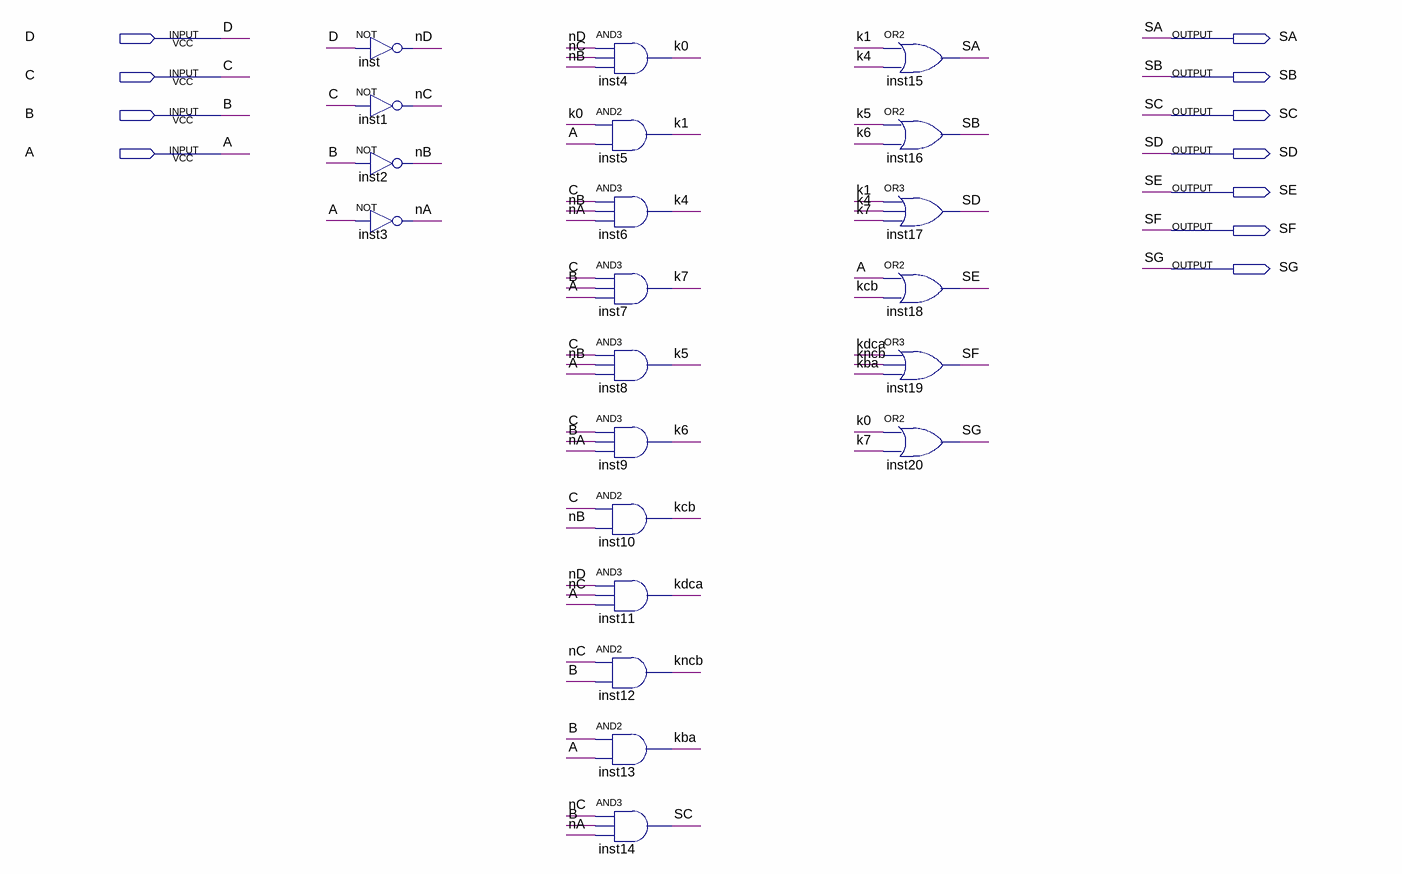
[diagram p0: schematic sheet]
// Quartus schematic seg7.bdf as structural Verilog: 21 symbols, 11 pins
module seg7 (
  input  D,
  input  C,
  input  B,
  input  A,
  output SA,
  output SB,
  output SC,
  output SD,
  output SE,
  output SF,
  output SG
);

  wire k0, k1, k4, k5, k6, k7, kba, kcb, kdca, kncb, nA, nB, nC, nD;

  not inst (nD, D);
  not inst1 (nC, C);
  not inst2 (nB, B);
  not inst3 (nA, A);
  and inst4 (k0, nD, nC, nB);
  and inst5 (k1, k0, A);
  and inst6 (k4, C, nB, nA);
  and inst7 (k7, C, B, A);
  and inst8 (k5, C, nB, A);
  and inst9 (k6, C, B, nA);
  and inst10 (kcb, C, nB);
  and inst11 (kdca, nD, nC, A);
  and inst12 (kncb, nC, B);
  and inst13 (kba, B, A);
  and inst14 (SC, nC, B, nA);
  or inst15 (SA, k1, k4);
  or inst16 (SB, k5, k6);
  or inst17 (SD, k1, k4, k7);
  or inst18 (SE, A, kcb);
  or inst19 (SF, kdca, kncb, kba);
  or inst20 (SG, k0, k7);
endmodule
